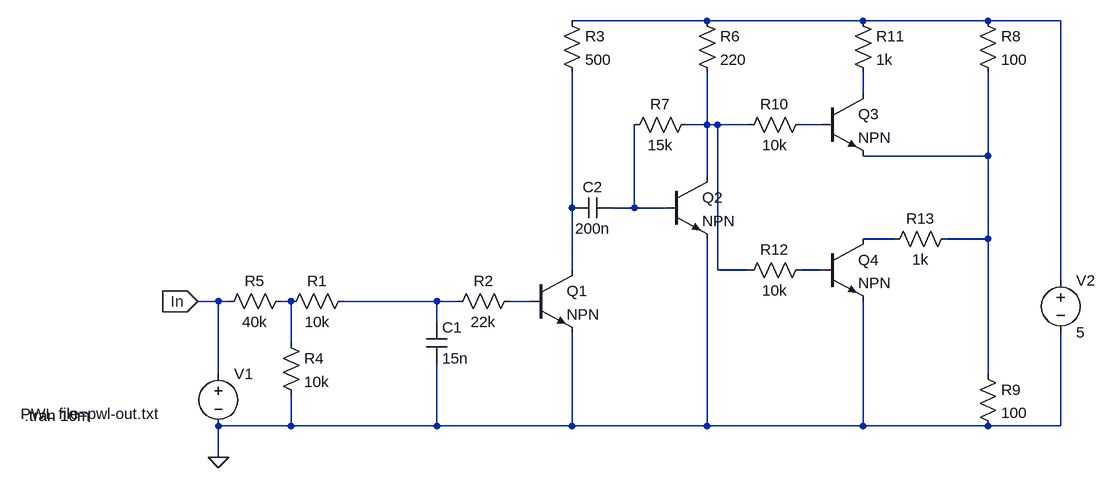
[diagram p0: schematic Filter2.asc]
Filter2.asc, the LTspice schematic file:
Version 4
SHEET 1 1336 680
WIRE 736 -896 528 -896
WIRE 976 -896 736 -896
WIRE 1168 -896 976 -896
WIRE 1280 -896 1168 -896
WIRE 976 -784 976 -816
WIRE 736 -736 736 -816
WIRE 736 -736 704 -736
WIRE 752 -736 736 -736
WIRE 800 -736 752 -736
WIRE 912 -736 880 -736
WIRE 1168 -688 1168 -816
WIRE 1168 -688 976 -688
WIRE 736 -656 736 -736
WIRE 528 -608 528 -816
WIRE 624 -608 624 -736
WIRE 624 -608 592 -608
WIRE 672 -608 624 -608
WIRE 1024 -560 976 -560
WIRE 1168 -560 1168 -688
WIRE 1168 -560 1104 -560
WIRE 528 -512 528 -608
WIRE 752 -512 752 -736
WIRE 800 -512 752 -512
WIRE 912 -512 880 -512
WIRE 1280 -496 1280 -896
WIRE -16 -464 -48 -464
WIRE 0 -464 -16 -464
WIRE 96 -464 80 -464
WIRE 320 -464 176 -464
WIRE 352 -464 320 -464
WIRE 464 -464 432 -464
WIRE 320 -432 320 -464
WIRE 96 -400 96 -464
WIRE -16 -352 -16 -464
WIRE 1168 -352 1168 -560
WIRE 96 -272 96 -320
WIRE 96 -272 -16 -272
WIRE 320 -272 320 -368
WIRE 320 -272 96 -272
WIRE 528 -272 528 -416
WIRE 528 -272 320 -272
WIRE 736 -272 736 -560
WIRE 736 -272 528 -272
WIRE 976 -272 976 -464
WIRE 976 -272 736 -272
WIRE 1168 -272 976 -272
WIRE 1280 -272 1280 -416
WIRE 1280 -272 1168 -272
WIRE -16 -224 -16 -272
FLAG -16 -224 0
FLAG -48 -464 In
IOPIN -48 -464 In
SYMBOL voltage -16 -368 R0
WINDOW 3 -304 77 Left 2
WINDOW 123 24 44 Left 2
WINDOW 39 24 44 Left 2
SYMATTR InstName V1
SYMATTR Value PWL file=pwl-out.txt
SYMBOL res 192 -480 R90
WINDOW 0 0 56 VBottom 2
WINDOW 3 32 56 VTop 2
SYMATTR InstName R1
SYMATTR Value 10k
SYMATTR SpiceLine tol=5
SYMBOL cap 304 -432 R0
SYMATTR InstName C1
SYMATTR Value 15n
SYMATTR SpiceLine V=25 Irms=728m Rser=0.14361 Lser=0
SYMBOL res 448 -480 R90
WINDOW 0 0 56 VBottom 2
WINDOW 3 32 56 VTop 2
SYMATTR InstName R2
SYMATTR Value 22k
SYMBOL voltage 1280 -512 R0
WINDOW 123 0 0 Left 0
WINDOW 39 0 0 Left 0
SYMATTR InstName V2
SYMATTR Value 5
SYMBOL res 512 -912 R0
SYMATTR InstName R3
SYMATTR Value 500
SYMBOL npn 464 -512 R0
SYMATTR InstName Q1
SYMBOL res 80 -416 R0
SYMATTR InstName R4
SYMATTR Value 10k
SYMBOL res 96 -480 R90
WINDOW 0 0 56 VBottom 2
WINDOW 3 32 56 VTop 2
SYMATTR InstName R5
SYMATTR Value 40k
SYMBOL cap 592 -624 R90
WINDOW 0 0 32 VBottom 2
WINDOW 3 32 32 VTop 2
SYMATTR InstName C2
SYMATTR Value 200n
SYMBOL npn 672 -656 R0
SYMATTR InstName Q2
SYMBOL res 720 -912 R0
SYMATTR InstName R6
SYMATTR Value 220
SYMBOL res 720 -752 R90
WINDOW 0 0 56 VBottom 2
WINDOW 3 32 56 VTop 2
SYMATTR InstName R7
SYMATTR Value 15k
SYMBOL res 1152 -912 R0
SYMATTR InstName R8
SYMATTR Value 100
SYMBOL res 1152 -368 R0
SYMATTR InstName R9
SYMATTR Value 100
SYMBOL npn 912 -560 R0
SYMATTR InstName Q4
SYMBOL res 896 -528 R90
WINDOW 0 0 56 VBottom 2
WINDOW 3 32 56 VTop 2
SYMATTR InstName R12
SYMATTR Value 10k
SYMBOL res 1120 -576 R90
WINDOW 0 0 56 VBottom 2
WINDOW 3 32 56 VTop 2
SYMATTR InstName R13
SYMATTR Value 1k
SYMBOL npn 912 -784 R0
SYMATTR InstName Q3
SYMBOL res 896 -752 R90
WINDOW 0 0 56 VBottom 2
WINDOW 3 32 56 VTop 2
SYMATTR InstName R10
SYMATTR Value 10k
SYMBOL res 960 -912 R0
SYMATTR InstName R11
SYMATTR Value 1k
TEXT -314 -288 Left 2 !.tran 10m

The netlist it stands for:
* Filter2.asc
V1 In 0 PWL file=pwl-out.txt
R1 N011 N010 10k tol=5
C1 N011 0 15n V=25 Irms=728m Rser=0.14361 Lser=0
R2 N012 N011 22k
V2 N001 0 5
R3 N001 N006 500
Q1 N006 N012 0 0 NPN
R4 N010 0 10k
R5 N010 In 40k
C2 N007 N006 200n
Q2 N003 N007 0 0 NPN
R6 N001 N003 220
R7 N003 N007 15k
R8 N001 N005 100
R9 N005 0 100
Q4 N008 N009 0 0 NPN
R12 N009 N003 10k
R13 N005 N008 1k
Q3 N002 N004 N005 0 NPN
R10 N004 N003 10k
R11 N001 N002 1k
.model NPN NPN
.model PNP PNP
.lib standard.bjt
.tran 10m
.backanno
.end